# Altium project OLED_PCB.PrjPcb
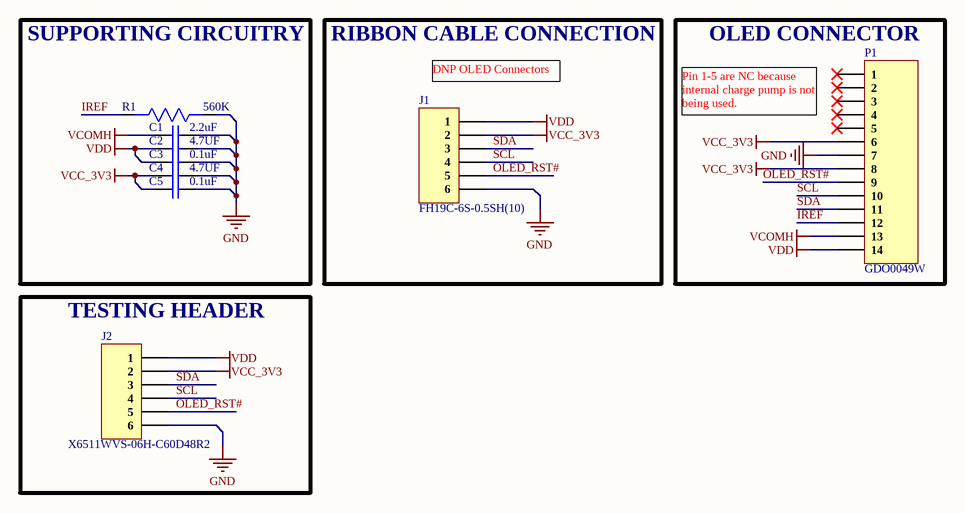
[diagram p0: OLED_Section.SchDoc]
1 sheet, 9 parts. Net scope: global (net labels, ports and power ports of the same name join across sheets).
Board file: OLED_PCB.PcbDoc

## Sheet OLED_Section.SchDoc
size A4; SheetNumber: 1; SheetTotal: 1

### Parts
C1  2.2uF  [Cap0603]
C2  4.7UF  [Cap0603]
C3  0.1uF  [Cap0603]
C4  4.7UF  [Cap0603]
C5  0.1uF  [Cap0603]
J1  FH19C-6S-0.5SH(10)  [FH19C-6S-0.5SH(10)]
J2  X6511WVS-06H-C60D48R2  [X6511WVS-06H-C60D48R2]
P1  GDO0049W  [GDO0049W]
R1  560K  [Res0603]

### Blocks framed on the sheet
SUPPORTING CIRCUITRY: C1-C5 R1
RIBBON CABLE CONNECTION: J1
OLED CONNECTOR: P1
TESTING HEADER: J2

### Nets
GND: C1.2 C2.2 C3.2 C4.2 C5.2 J1.6 J2.6 P1.7 R1.1
VCC_3V3: C4.1 C5.1 J1.2 J2.2 P1.6 P1.8
VCOMH: C1.1 P1.13
VDD: C2.1 C3.1 J1.1 J2.1 P1.14
IREF: P1.12 R1.2
OLED_RST#: J1.5 J2.5 P1.9
SCL: J1.4 J2.4 P1.10
SDA: J1.3 J2.3 P1.11

Not connected (* = marked no-connect by the designer): P1 1* 2* 3* 4* 5*

### Notes on the sheet
- (near J1) DNP OLED Connectors
- (near P1) Pin 1-5 are NC because internal charge pump is not being used.
- 1
- Huzaifa Ali

### Library data of the parts
C1 = CC0603KRX5R8BB225: CAP CER 2.2UF 25V X5R 0603; Manufacturer: Yageo; Tolerance: 10%; Supplier 1: Digi-Key; Manufacturer Part Number: CC0603KRX5R8BB225; Stock 1: 687936; Pricing 1: 1=0.4, 10=0.276, 50=0.1932, 100=0.1656, 500=0.1242, 1000=0.10488 (USD); Mount: Surface Mount; Case/Package: 0603; Case Code (Metric): 1608; Case Code (Imperial): 0603; Weight: 7.1E-05oz; Min Operating Temperature: -55°C; Max Operating Temperature: 85°C; Packaging: Tape and Reel; Capacitance: 2.2uF; Dielectric: X5R; Voltage Rating: 25V; Termination: SMD/SMT; Resistor Type: Ceramic; Voltage Rating (DC): 25V; Package Quantity: 4000; Length: 1.6mm; Width: 0.031inch; Thickness: 0.037inch; Depth: 0.8mm; Radiation Hardening: No; Lead Free: Lead Free; Halogen Free: Halogen Free; RoHS Compliant: Yes; ComponentLink1URL: https://www.verical.com/server-webapp/html/getDatasheet?partID=782757&src-supplier=Verical; ComponentLink1Description: https://www.verical.com/server-webapp/html/getDatasheet?partID=782757&src-supplier=Verical; Supplier Part Number 1: 311-1786-1-ND
C2 C4 = CL10A475KA8NQNC: CAP CER 4.7UF 25V X5R 0603; Manufacturer: Samsung; Tolerance: 10%; Supplier 1: Digi-Key; Manufacturer Part Number: CL10A475KA8NQNC; Stock 1: 2252340; Pricing 1: 1=0.37, 10=0.255, 100=0.1528, 500=0.11456, 1000=0.09675 (USD); Mount: Surface Mount; Case/Package: 0603; Case Code (Metric): 1608; Case Code (Imperial): 0603; Contact Plating: Tin; Min Operating Temperature: -55°C; Max Operating Temperature: 85°C; Package Quantity: 1; Packaging: Tape and Reel; Capacitance: 4.7uF; Voltage Rating: 25V; Dielectric: X5R; Termination: Wraparound; Length: 1.6mm; Width: 0.031inch; Thickness: 0.035inch; Depth: 0.8mm; Lead Free: Lead Free; ComponentLink1URL: http://www.samsungsem.com/kr/support/product-search/mlcc/CL10A475KA8NQNC.jsp?src-supplier=Digi-Key; ComponentLink1Description: http://www.samsungsem.com/kr/support/product-search/mlcc/CL10A475KA8NQNC.jsp?src-supplier=Digi-Key; Supplier Part Number 1: 1276-1900-1-ND
C3 C5 = CC0603ZRY5V9BB104: CAP CER 0.1UF 50V Y5V 0603; Manufacturer: Yageo; Capacitance: 100nF; Tolerance: 80%; Supplier 1: Digi-Key; Manufacturer Part Number: CC0603ZRY5V9BB104; Stock 1: 15000880; Pricing 1: 1=0.1, 10=0.075, 100=0.0334, 500=0.02386, 1000=0.01874 (USD); Mount: Surface Mount; Case/Package: 0603; Number of Pins: 2; Case Code (Metric): 1608; Case Code (Imperial): 0603; Min Operating Temperature: -30°C; Max Operating Temperature: 85°C; Dielectric: Y5V; Voltage Rating: 50V; Package Quantity: 1; Packaging: Tape and Reel; Voltage Rating (DC): 50V; Termination: SMD/SMT; Composition: Ceramic; Voltage: 50V; Length: 1.6mm; Height: 0.8mm; Width: 0.031inch; Thickness: 0.035inch; Depth: 0.8mm; Radiation Hardening: No; REACH SVHC: No SVHC; Lead Free: Lead Free; Halogen Free: Halogen Free; ComponentLink1URL: http://www.yageo.com/documents/recent/UPY-GPHC_Y5V_6.3V-to-50V_8.pdf?src-supplier=Digi-Key; ComponentLink1Description: http://www.yageo.com/documents/recent/UPY-GPHC_Y5V_6.3V-to-50V_8.pdf?src-supplier=Digi-Key; ComponentLink2URL: http://www.yageo.com/documents/recent/UPY-GPHC_Y5V_6.3V-to-50V_5.pdf?src-supplier=Avnet+Europe; ComponentLink2Description: http://www.yageo.com/documents/recent/UPY-GPHC_Y5V_6.3V-to-50V_5.pdf?src-supplier=Avnet+Europe; ComponentLink3URL: https://www.verical.com/server-webapp/html/getDatasheet?partID=403611&src-supplier=Verical; ComponentLink3Description: https://www.verical.com/server-webapp/html/getDatasheet?partID=403611&src-supplier=Verical; ComponentLink4URL: http://www.mouser.com/ds/2/447/Yageo_UPY-GP_NP0_16V-to-50V_9-358835.pdf?src-supplier=Mouser; ComponentLink4Description: http://www.mouser.com/ds/2/447/Yageo_UPY-GP_NP0_16V-to-50V_9-358835.pdf?src-supplier=Mouser; ComponentLink5URL: http://www.farnell.com/datasheets/1132289.pdf?src-supplier=Element14; ComponentLink5Description: http://www.farnell.com/datasheets/1132289.pdf?src-supplier=Element14; Supplier Part Number 1: 311-1343-1-ND
J1 = FH19C-6S-0.5SH(10): 0.5mm Pitch, 0.9mm Height, No of Contact 4-50, FPC/FFC Connector, 0.5 A, -55 to 85 ℃, RoHS; Manufacturer: Hirose; Supplier 1: Digi-Key; Manufacturer Part Number: FH19C-6S-0.5SH(10); RoHS: Yes; Category: FFC / FPC; Stock 1: 1159; Pricing 1: 1=1.10000, 10=0.96900, 25=0.91200, 50=0.87400, 100=0.83600, 250=0.76000, 500=0.68400, 1000=0.60800, 2500=0.55100 (USD); ComponentLink1URL: https://datasheet.ciiva.com/18563/ed-fh19cfh19sc-20140305-18563530.pdf?src-supplier=Digi-Key; ComponentLink1Description: https://datasheet.ciiva.com/18563/ed-fh19cfh19sc-20140305-18563530.pdf?src-supplier=Digi-Key; Supplier Part Number 1: H125824CT-ND
J2 = X6511WVS-06H-C60D48R2: 6 POS 2.54mm SMD Header; Manufacturer: XKB Connectivity; Voltage Rating (Max): 250V; Current Rating (Max): 3A; Circluar Pins/Square Pins: Square Pins; ComponentLink1Description: LCSC; ComponentLink1URL: https://lcsc.com/product-detail/span-style-background-color-ff0-Pin-span-Headers_XKB-Connectivity-X6511WVS-06H-C60D48R2_C2883763.html; Insulation Height: 2.5mm; Length of Mating Pin: 6mm
P1 = GDO0049W: Monochrome/ 64x32 Resolution/ IIC Interface/ SSD1306/ FPC Soldering OLED; Manufacturer: Good Display; Manufacturer Part Number: GDO0049W; Footprint: Custom; ComponentLink1Description: Good Display; ComponentLink1URL: https://www.good-display.com/product/294.html
R1 = AECR0603F560KK9: ±1% 100mW Thick Film Resistors 50V ±100ppm/℃ -55℃~+125℃ 560kΩ 0603 Chip Resistor - Surface Mount ROHS; Manufacturer: Resistor.Today; Manufacturer Part No: AECR0603F560KK9; Value: 560K; Package: 0603